# EasyEDA Pro project ProPrj_Codex_key_2026-10-20_10-08-15_2026-11-04.epro, board Keyboard_91_Centered_1
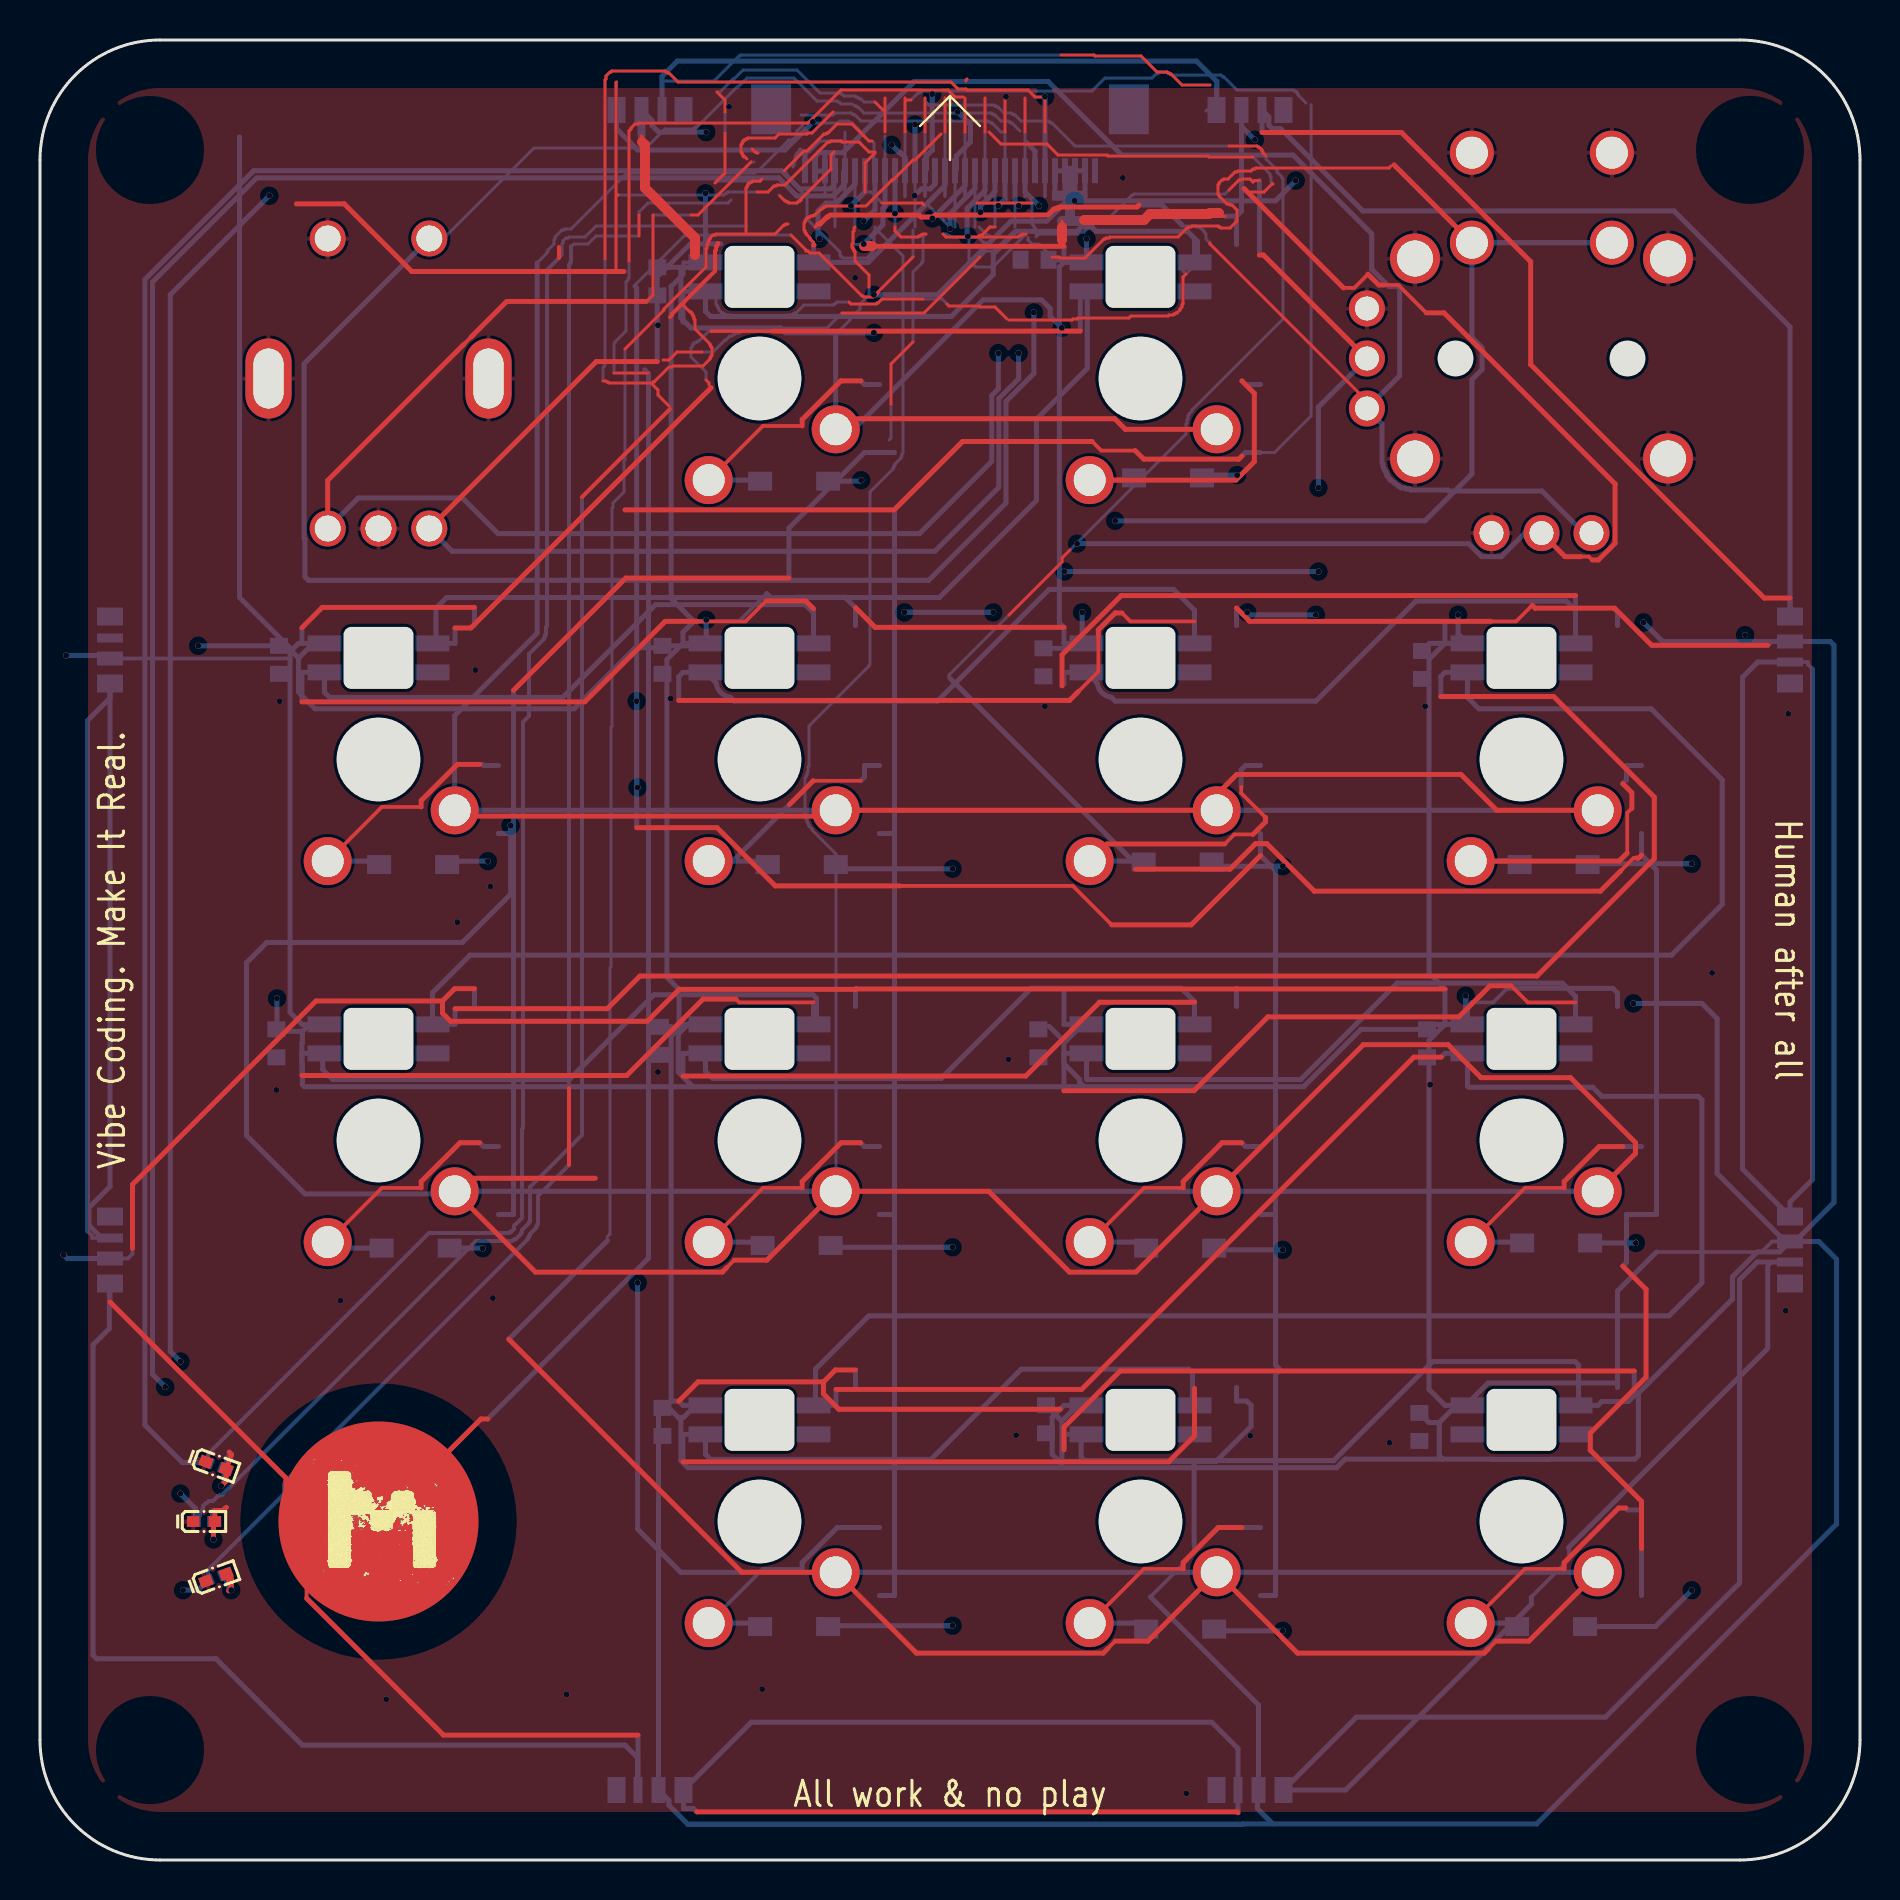
[diagram p6: board, top side]
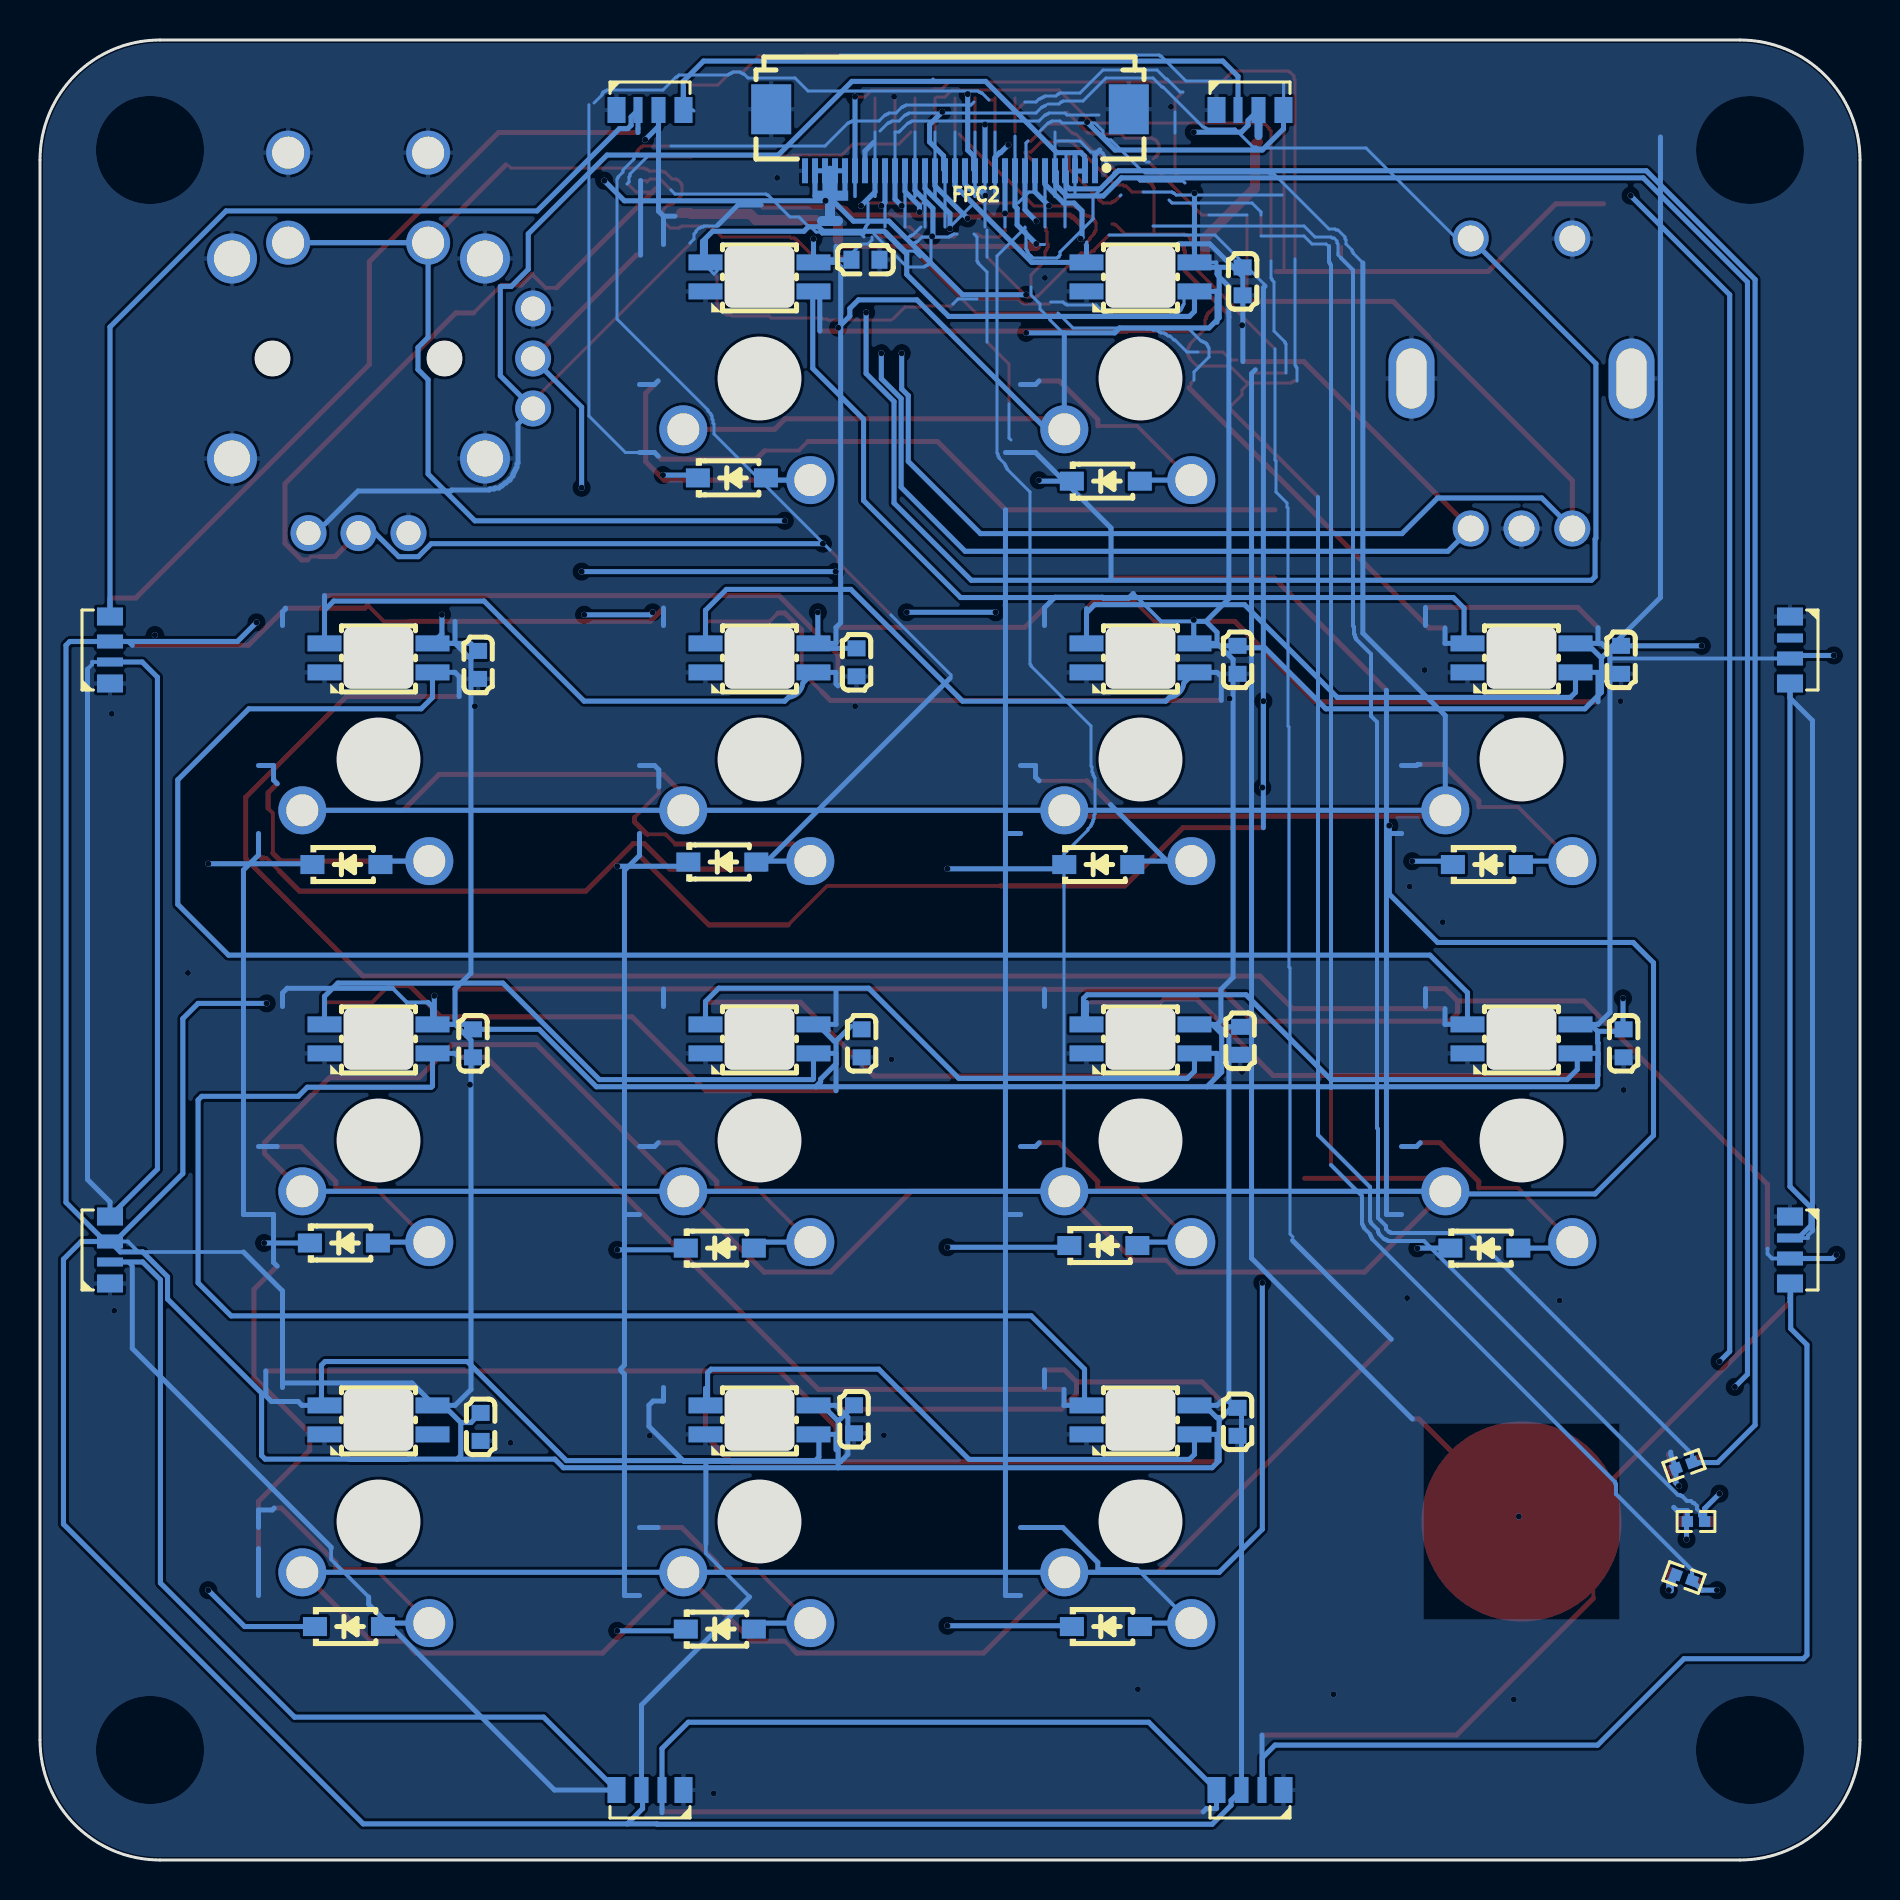
[diagram p7: board, bottom side, seen from below]

Outline 91 x 91 mm; copper layers: Top Layer, In1.Cu, In2.Cu, Bottom Layer. Coordinates in mm from the lower left corner of the outline.
Outline path: 0,85 arc(1.76,89.24) 6,91 85,91 arc(89.24,89.24) 91,85 91,6 arc(89.24,1.76) 85,0 6,0 arc(1.76,1.76) 0,6 0,85
Stack: Top Layer 0.035mm Outer layer thickness 1oz / Dielectric1 0.2104mm 7628 RC49% 8.6mil / In1.Cu 0.035mm / Dielectric2 1.065mm 1.1mm H/HOZ Copper / In2.Cu 0.035mm / Dielectric3 0.2104mm 7628 RC49% 8.6mil / Bottom Layer 0.035mm Outer layer thickness 1oz

## Design rules (mm)
spacing copperThickness1oz (default): track to track 0.102, other pairs 0.152 to 0.3
spacing safeClearance1: track to track 0.152, other pairs 0.152 to 0.3
track width copperThickness1oz (default): min 0.127, default 0.254, max 2.54
differential pair differentialPair (default): width min 0.127, default 2.54, max 2.54; gap min 0.127, default 0.152
pour e1721 uses copper0_default, default
net GND uses copper0_copperThickness1oz
pour e3085 uses copper0_safeClearance1, safeClearance1

## Placement (name value [footprint] x y rotation side)
C1  100nF  [C0603]  30.87 78.93 90 bottom
C2  100nF  [C0603]  49.73 80.01 0 bottom
C3  100nF  [C0603]  11.95 60.01 90 bottom
C4  100nF  [C0603]  31.12 60.01 90 bottom
C5  100nF  [C0603]  50.17 59.88 90 bottom
C6  100nF  [C0603]  69.1 59.75 90 bottom
C7  100nF  [C0603]  11.82 40.83 90 bottom
C8  100nF  [C0603]  31 40.96 90 bottom
C9  100nF  [C0603]  49.92 40.83 90 bottom
C10  100nF  [C0603]  69.35 40.83 90 bottom
C11  100nF  [C0603]  31.12 21.91 90 bottom
C12  100nF  [C0603]  50.3 22.04 90 bottom
C13  100nF  [C0603]  68.97 21.66 90 bottom
D1  1N4148W-7-F  [SOD-123_L2.7-W1.6-LS3.7-RD-1]  37.71 68.94 180 bottom
D2  1N4148W-7-F  [SOD-123_L2.7-W1.6-LS3.7-RD-1]  56.4 69.11 180 bottom
D3  1N4148W-7-F  [SOD-123_L2.7-W1.6-LS3.7-RD-1]  18.66 49.77 180 bottom
D4  1N4148W-7-F  [SOD-123_L2.7-W1.6-LS3.7-RD-1]  38.09 49.77 180 bottom
D5  1N4148W-7-F  [SOD-123_L2.7-W1.6-LS3.7-RD-1]  56.88 49.9 180 bottom
D6  1N4148W-7-F  [SOD-123_L2.7-W1.6-LS3.7-RD-1]  75.68 49.77 180 bottom
D7  1N4148W-7-F  [SOD-123_L2.7-W1.6-LS3.7-RD-1]  18.78 30.59 180 bottom
D8  1N4148W-7-F  [SOD-123_L2.7-W1.6-LS3.7-RD-1]  37.83 30.72 180 bottom
D9  1N4148W-7-F  [SOD-123_L2.7-W1.6-LS3.7-RD-1]  57.01 30.59 180 bottom
D10  1N4148W-7-F  [SOD-123_L2.7-W1.6-LS3.7-RD-1]  75.81 30.85 180 bottom
D11  1N4148W-7-F  [SOD-123_L2.7-W1.6-LS3.7-RD-1]  37.71 11.67 180 bottom
D12  1N4148W-7-F  [SOD-123_L2.7-W1.6-LS3.7-RD-1]  57.01 11.54 180 bottom
D13  1N4148W-7-F  [SOD-123_L2.7-W1.6-LS3.7-RD-1]  75.55 11.67 180 bottom
FPC2  FPC-05F-30PH20  [FPC-SMD_30P-P0.50_XUNPU_FPC-05F-30PH20]  45.5 86 0 bottom
LED1  SK6812MINI-E  [LED-SMD_4P-L3.2-W2.8-LS5.9_SK6812MINI-E]  35.97 79.16 180 bottom
LED2  SK6812MINI-E  [LED-SMD_4P-L3.2-W2.8-LS5.9_SK6812MINI-E]  55.03 79.16 180 bottom
LED3  SK6812MINI-E  [LED-SMD_4P-L3.2-W2.8-LS5.9_SK6812MINI-E]  16.92 60.11 180 bottom
LED4  SK6812MINI-E  [LED-SMD_4P-L3.2-W2.8-LS5.9_SK6812MINI-E]  35.97 60.11 180 bottom
LED5  SK6812MINI-E  [LED-SMD_4P-L3.2-W2.8-LS5.9_SK6812MINI-E]  55.03 60.11 180 bottom
LED6  SK6812MINI-E  [LED-SMD_4P-L3.2-W2.8-LS5.9_SK6812MINI-E]  74.07 60.11 180 bottom
LED7  SK6812MINI-E  [LED-SMD_4P-L3.2-W2.8-LS5.9_SK6812MINI-E]  16.92 41.06 180 bottom
LED8  SK6812MINI-E  [LED-SMD_4P-L3.2-W2.8-LS5.9_SK6812MINI-E]  35.97 41.06 180 bottom
LED9  SK6812MINI-E  [LED-SMD_4P-L3.2-W2.8-LS5.9_SK6812MINI-E]  55.03 41.06 180 bottom
LED10  SK6812MINI-E  [LED-SMD_4P-L3.2-W2.8-LS5.9_SK6812MINI-E]  74.07 41.06 180 bottom
LED11  SK6812MINI-E  [LED-SMD_4P-L3.2-W2.8-LS5.9_SK6812MINI-E]  35.97 22 180 bottom
LED12  SK6812MINI-E  [LED-SMD_4P-L3.2-W2.8-LS5.9_SK6812MINI-E]  55.03 22 180 bottom
LED13  SK6812MINI-E  [LED-SMD_4P-L3.2-W2.8-LS5.9_SK6812MINI-E]  74.07 22 180 bottom
NOREF  -  [Pad_e2175]  16.92 16.93 0 top
NOREF#2  -  [Pad_e2006]  51.47 83.22 0 top
R1  1kΩ  [R0402]  8.8 19.72 340 bottom
R2  1kΩ  [R0402]  8.8 14.12 20 bottom
R5  1kΩ  [R0402]  8.2 16.93 0 bottom
SW1  EC11E18244A5  [SW-TH_EC11E18244A5]  16.92 73.83 0 top
U1  CPG151101D13  [KEY-TH_CPG151101D21X]  36.61 70.27 180 top
U2  WS2812B-4020-V6  [LED-SMD_4P-L4.0-W1.7_DCS-CA4020A0R02G02B02CE004]  30.5 87.5 0 bottom
U3  WS2812B-4020-V6  [LED-SMD_4P-L4.0-W1.7_DCS-CA4020A0R02G02B02CE004]  60.5 87.5 0 bottom
U4  CPG151101D13  [KEY-TH_CPG151101D21X]  55.66 70.27 180 top
U5  CPG151101D13  [KEY-TH_CPG151101D21X]  17.56 51.22 180 top
U6  WS2812B-4020-V6  [LED-SMD_4P-L4.0-W1.7_DCS-CA4020A0R02G02B02CE004]  87.5 60.5 270 bottom
U7  CPG151101D13  [KEY-TH_CPG151101D21X]  36.61 51.22 180 top
U8  WS2812B-4020-V6  [LED-SMD_4P-L4.0-W1.7_DCS-CA4020A0R02G02B02CE004]  87.5 30.5 270 bottom
U9  WS2812B-4020-V6  [LED-SMD_4P-L4.0-W1.7_DCS-CA4020A0R02G02B02CE004]  60.5 3.5 180 bottom
U10  WS2812B-4020-V6  [LED-SMD_4P-L4.0-W1.7_DCS-CA4020A0R02G02B02CE004]  30.5 3.5 180 bottom
U11  WS2812B-4020-V6  [LED-SMD_4P-L4.0-W1.7_DCS-CA4020A0R02G02B02CE004]  3.5 30.5 90 bottom
U12  WS2812B-4020-V6  [LED-SMD_4P-L4.0-W1.7_DCS-CA4020A0R02G02B02CE004]  3.5 60.5 90 bottom
U13  XL-1005UWC  [LED0402-RD_YELLOW]  8.8 19.72 340 top
U14  CPG151101D13  [KEY-TH_CPG151101D21X]  55.66 51.22 180 top
U15  CPG151101D13  [KEY-TH_CPG151101D21X]  74.71 51.22 180 top
U16  CPG151101D13  [KEY-TH_CPG151101D21X]  17.56 32.17 180 top
U17  CPG151101D13  [KEY-TH_CPG151101D21X]  36.61 32.17 180 top
U18  CPG151101D13  [KEY-TH_CPG151101D21X]  55.66 32.17 180 top
U19  CPG151101D13  [KEY-TH_CPG151101D21X]  74.71 32.17 180 top
U20  CPG151101D13  [KEY-TH_CPG151101D21X]  36.61 13.12 180 top
U21  CPG151101D13  [KEY-TH_CPG151101D21X]  55.66 13.12 180 top
U22  CPG151101D13  [KEY-TH_CPG151101D21X]  74.71 13.12 180 top
U23  XL-1005UWC  [LED0402-RD_YELLOW]  8.2 16.93 0 top
U24  XL-1005UWC  [LED0402-RD_YELLOW]  8.8 14.12 20 top
VR1  10kΩ  [SW-TH_RKJXV1224005]  73.87 75.86 180 top

## Footprints (pads in the part's own frame, mm; a bottom-side part is the same pattern mirrored in y, then rotated)
C0603
  rect 0.8x0.9 smd: 1(-0.7,0) 2(0.7,0)
FPC-SMD_30P-P0.50_XUNPU_FPC-05F-30PH20
  rect 0.3x1.25 smd: 1(-7.25,1.538) 2(-6.75,1.538) 3(-6.25,1.538) 4(-5.75,1.538) 5(-5.25,1.538) 6(-4.75,1.538) 7(-4.25,1.538) 8(-3.75,1.538) 9(-3.25,1.538) 10(-2.75,1.538) 11(-2.25,1.538) 12(-1.75,1.538) 13(-1.25,1.538) 14(-0.75,1.538) 15(-0.25,1.538) 16(0.25,1.538) 17(0.75,1.538) 18(1.25,1.538) 19(1.75,1.538) 20(2.25,1.538) 21(2.75,1.538) 22(3.25,1.538) 23(3.75,1.538) 24(4.25,1.538) 25(4.75,1.538) 26(5.25,1.538) 27(5.75,1.538) 28(6.25,1.538) 29(6.75,1.538) 30(7.25,1.538)
  rect 2x2.5 smd: 31(8.94,-1.538) 32(-8.94,-1.538)
KEY-TH_CPG151101D21X
  round 2.4 hole 1.6: 1(-3.175,-1.27) 2(3.175,1.27)
LED0402-RD_YELLOW
  rect 0.636x0.54 smd: 1(-0.538,0) 2(0.538,0)
LED-SMD_4P-L3.2-W2.8-LS5.9_SK6812MINI-E
  rect 1.7x0.8 smd: 1(-2.7,-0.725) 2(-2.7,0.725) 3(2.7,0.725) 4(2.7,-0.725)
LED-SMD_4P-L4.0-W1.7_DCS-CA4020A0R02G02B02CE004
  rect 0.9x1.3 smd: 1(-1.675,0) 4(1.675,0)
  rect 0.7x1.3 smd: 2(-0.425,0)
  rect 0.45x1.3 smd: 3(0.6,0)
Pad_e2006
  custom 1.761x0.516 smd far side: 33(0,0)
Pad_e2175
  round 10 smd: 1(0,0)
R0402
  rect 0.566x0.54 smd: 1(-0.433,0) 2(0.433,0)
SOD-123_L2.7-W1.6-LS3.7-RD-1
  rect 1.2x0.95 smd: 1(-1.7,0) 2(1.7,0)
SW-TH_EC11E18244A5
  oval 2.3x4 hole 1.5x3: 6(5.5,0.25) 7(-5.5,0.25)
  round 1.8 hole 1.3: A(-2.54,-7.25) B(2.54,-7.25) C(0,-7.25) D(-2.54,7.25) E(2.54,7.25)
SW-TH_RKJXV1224005
  round 1.8 hole 1.2: 1(7.527,-1.719) 2(7.527,0.781) 3(7.527,3.281) 4(1.298,9.511) 5(-1.202,9.511) 6(-3.703,9.511)
  round 2.5 hole 1.8: 7(-7.527,5.781) 8(-7.527,-4.219) 9(5.122,-4.219) 10(5.122,5.781)
  round 2.2 hole 1.6: a(-4.721,-5.011) b(-4.721,-9.511) c(2.279,-5.011) d(2.279,-9.511)

## Nets
As in the schematic, except:
+5V: C1.2 C2.2 C3.2 C4.2 C5.2 C6.2 C7.2 C8.2 C9.2 C10.2 C11.2 C12.2 C13.2 FPC2.26 FPC2.27 FPC2.28 FPC2.29 LED1.3 LED2.3 LED3.3 LED4.3 LED5.3 LED6.3 LED7.3 LED8.3 LED9.3 LED10.3 LED11.3 LED12.3 LED13.3 NOREF#2.33 U2.2 U3.2 U6.2 U8.2 U9.2 U10.2 U11.2 U12.2
Touch: FPC2.17 NOREF.1

Pads without a net: LED13 4; U12 3

## Via types
v1: diameter 0.305, hole 0.61, Top Layer to Bottom Layer, 105 vias

## Routing (per net, layer and track width the routed paths; a pad name or vN(x,y) marks a point on that pad's centre or on a via; arc(x,y) is an arc through that point)
+5V: length 520.3
  In2.Cu w0.254: v1(52.32,81.06) 51.73,81.65 v1(51.73,82.96) ; v1(33.31,62.01) 33.59,62.29 43.12,62.29 v1(43.22,62.39) ; v1(79.67,42.83) 78.02,42.83 77.63,43.21 v1(71.28,43.21) ; v1(41.69,78.26) v1(41.69,76.36) ; v1(60.36,62.39) v1(52.11,62.39) v1(47.66,62.39) ; v1(33.28,83.34) 33.31,83.38 v1(33.31,86.39) ; v1(85.25,61.24) 85.25,62.47 71.32,76.4 70.35,76.4 68.02,78.73 arc(67.67,78.99) 67.4,79.35 v1(62.79,83.97) v1(60.74,86.01) ; v1(80.18,61.88) 79.79,62.26 v1(70.9,62.26) v1(63.79,62.26) ; v1(1.31,60.23) 1.79,60.71 v1(7.91,60.71) ; v1(1.18,30.26) 1.18,32.42 v1(11.85,43.08)
  Bottom Layer w0.254: 51.09,19.61 32.4,19.61 32.04,19.97 32.04,22 31.91,22.13 ; 51.09,19.61 64.83,19.61 65.26,20.04 70.14,20.04 ; 51.09,19.61 51.09,21.94 ; 52.21,38.66 51.97,38.91 51.97,39.04 51.2,39.81 51.2,40.95 ; 52.21,38.66 32.65,38.66 ; 52.21,38.66 63.18,38.66 66.05,41.53 C10.2 69.6,41.78 LED10.3 71.28,41.87 v1(71.28,43.21) ; v1(52.11,62.39) 52.11,61.05 52.32,60.83 52.08,60.58 C5.2 ; 52.2,80.01 52.19,80.01 C2.2 ; 52.2,80.01 52.32,79.88 ; 52.2,80.01 52.32,80.13 v1(52.32,81.06) ; 51.9,83.07 52.1,83.07 52.25,83.22 FPC2.29 ; 32.65,38.66 13.22,38.66 13.12,38.77 13.12,39.79 13.1,39.81 13.1,40.85 13.12,40.87 13.12,41.43 ; 32.65,38.66 31.91,39.4 31.91,41.31 ; v1(33.31,62.01) 33.31,60.87 LED4.3 33.15,60.71 C4.2 31.02,60.61 29.76,60.61 26.71,57.56 13.75,57.56 12.93,58.39 12.93,60.1 ; v1(60.36,62.39) 60.49,62.26 v1(63.79,62.26) ; 31.91,41.31 31.56,41.66 C8.2 ; 31.91,41.31 32.39,41.78 LED8.3 ; U10.2 31.45,2.98 31.45,2.73 32.39,1.79 60.14,1.79 60.16,1.81 61.63,1.81 ; 70.14,20.04 72.57,20.04 arc(72.65,20.03) 72.72,20.03 75.43,20.03 arc(75.5,20.03) 75.58,20.04 79.74,20.04 79.92,20.22 79.92,23.35 84.62,28.05 84.62,29.16 85.87,30.4 86.98,30.4 U8.2 87.25,30.92 83.86,34.32 83.86,42.07 83.1,42.83 v1(79.67,42.83) ; 70.14,20.04 69.96,20.22 69.96,21.87 ; C6.2 69.47,60.83 LED6.3 70.9,61.3 v1(70.9,62.26) ; 31.91,22.13 32.17,22.13 32.77,22.73 LED11.3 ; 31.91,22.13 31.43,22.61 31.12,22.61 ; 12.93,60.1 13.66,60.83 LED3.3 ; 12.93,60.1 12.32,60.71 C3.2 v1(7.91,60.71) ; 13.12,41.43 11.92,41.43 C7.2 11.85,41.56 v1(11.85,43.08) ; 13.12,41.43 13.47,41.78 LED7.3 ; v1(41.69,78.26) 44.87,78.26 48.55,81.94 50.33,81.94 51.47,83.09 ; U11.2 1.36,30.08 v1(1.18,30.26) ; FPC2.28 51.75,83.22 ; 51.2,40.95 51.3,40.95 52.13,41.78 52.32,41.78 ; 51.2,40.95 50.46,41.69 ; v1(41.69,76.36) 37.27,76.36 37.02,76.6 32.55,76.6 32.04,77.11 32.04,79.61 32.06,79.63 ; U3.2 60.07,86.68 v1(60.74,86.01) ; 51.09,21.94 51.88,22.73 52.32,22.73 ; 51.09,21.94 C12.2 ; U12.2 3.35,60.23 v1(1.31,60.23) ; 50.9,83.2 50.75,83.34 FPC2.26 ; C1.2 32.06,79.63 ; 32.06,79.63 33.03,79.63 LED1.3 v1(33.28,83.34) ; v1(47.66,62.39) v1(43.22,62.39) ; 69.96,21.87 69.45,21.87 C13.2 ; 69.96,21.87 70.82,22.73 LED13.3 ; 61.63,1.81 60.87,2.57 60.87,3.45 U9.2 ; 61.63,1.81 74.84,1.81 89.83,16.79 89.83,30.04 88.94,30.92 87.75,30.92 89.7,32.88 89.7,60.74 89.51,60.92 U6.2 81.13,60.92 v1(80.18,61.88) ; U2.2 30.6,86.98 30.6,86.73 30.94,86.39 v1(33.31,86.39) ; v1(62.79,83.97) 61.78,82.96 51.9,82.96 ; NOREF#2.33 51.38,83.22 ; 51.25,83.34 FPC2.27
GND: length 4.7
  Bottom Layer w0.254: v1(43.73,83.22) 44.07,83.56 44.52,83.56 44.75,83.79 FPC2.14 ; FPC2.1 38.25,85.26 38.01,85.5 ; FPC2.24 49.75,85.45 49.32,85.88
  vias: v1(11.82,38.5) v1(11.98,57.94) v1(15.02,27.97) v1(17.31,8.03) v1(20.87,46.89) v1(21.77,59.5) v1(22.52,48.67) v1(22.64,28.1) v1(26.33,8.28) v1(30.9,76.74) v1(30.9,39.4) v1(31.53,58.07) v1(34.46,87.66) v1(36.11,8.54) v1(40.75,79.11) v1(48.3,88.17) v1(48.43,40.03) v1(48.81,21.24) v1(50.25,57.69) v1(54.14,84.1) v1(57.31,3.33) v1(60.52,21.21) v1(67.47,20.86) v1(69.25,57.69) v1(69.51,38.77) v1(83.6,44.35) v1(87.29,27.46) v1(87.41,57.31)
VCC: length 58.3
  In2.Cu w0.254: VR1.6 71.34,72.58 66.35,72.58
  Bottom Layer w0.254: FPC2.2 38.77,84.49 38.77,85.19 38.95,85.37 39.24,85.37 ; 39.24,85.37 39.25,85.36 FPC2.3 ; 39.24,85.37 40.15,85.37 43.72,88.93 50.4,88.93 54.09,85.25 62.65,85.25 66.59,81.31 66.59,79.53 67.44,78.68 67.98,78.68 67.98,74.21 66.35,72.58
(no net): length 3065.4
  Top Layer w0.15: 48.45,62.25 51.1,64.9 51.1,65.1 51.5,65.5 ; 41.75,85.35 41.25,84.85 41.25,83.4 ; 32.55,82.25 32.9,82.25 35.55,84.9 ; 29.25,75.55 31.2,77.5 31.2,77.55 33.3,79.65 33.3,80.55 33.35,80.6 33.35,80.75 33.4,80.8 33.4,80.9 33.45,80.95 33.45,81 33.5,81.05 33.5,81.1 33.65,81.25 33.75,81.25 33.8,81.3 36.75,81.3 37.2,81.75 37.25,81.75 37.3,81.8 37.4,81.8 ; 44.2,82.75 44.1,82.85 42.1,82.85 ; 30.6,73.8 30.9,73.5 30.9,73.25 31.45,72.7 ; 44.25,86.4 44.25,88.1 ; 50.25,86.4 50.25,88.1 ; 46.3,88.95 46.3,89 46.35,89.05 ; 38.75,81.65 38.9,81.8 ; 28.25,80.05 28.25,89 28.3,89.05 28.3,89.2 28.5,89.4 28.55,89.4 28.6,89.45 31.25,89.45 31.3,89.4 31.35,89.4 31.4,89.35 31.45,89.35 31.9,88.9 45.55,88.9 45.9,88.55 46.3,88.55 46.35,88.5 49.4,88.5 49.75,88.15 50.15,88.15 ; 29.45,79.95 29.45,86.45 29.55,86.55 29.55,86.6 29.75,86.8 29.9,86.8 29.95,86.85 38.4,86.85 40.05,88.5 45.4,88.5 45.75,88.15 46.15,88.15 ; 47,81.15 48.9,81.15 48.95,81.2 49,81.2 49.05,81.25 49.1,81.25 49.15,81.3 49.3,81.3 ; 33.45,73.75 33.45,73.85 33.3,74 ; 47.45,86.4 48.05,85.8 50.35,85.8 50.9,85.25 53.35,85.25 53.4,85.2 58.4,85.2 58.45,85.15 60.65,85.15 ; 44.15,78.05 42.1,78.05 41.9,77.85 41.85,77.85 41.8,77.8 40.55,77.8 40.45,77.9 ; 34.25,87.4 34.25,88 33.85,88.4 ; 49.25,86.4 49.25,88.1 ; 48.45,77 51.6,77 51.65,77.05 51.85,77.05 51.9,77.1 54.45,77.1 54.55,77.2 56.4,77.2 56.45,77.25 56.65,77.25 56.7,77.3 56.75,77.3 56.8,77.35 56.85,77.35 57,77.5 57,77.55 57.1,77.65 57.1,77.75 57.15,77.8 57.15,79.15 57.3,79.3 ; 31.45,74.65 31.6,74.65 31.65,74.7 33.15,74.7 33.5,75.05 33.5,75.1 33.55,75.15 33.55,75.2 33.6,75.25 33.6,75.6 33.55,75.65 33.55,75.7 33.5,75.75 33.5,75.8 32.75,76.55 32.75,77 32.7,77.05 32.7,77.15 32.65,77.2 32.65,77.25 32.6,77.3 32.6,77.35 32.55,77.4 32.5,77.4 32.15,77.75 ; 42.75,81.65 42.75,81.45 43.05,81.15 43.9,81.15 43.95,81.2 44,81.2 44.05,81.25 44.1,81.25 44.15,81.3 44.3,81.3 ; 58.95,82.35 59.11,82.19 59.25,82.19 ; 42.55,72.8 42.55,74.8 43.65,75.9 ; 59.45,83.5 59.95,84 60.05,84 60.1,84.05 60.5,84.05 60.65,83.9 60.72,83.97 60.97,83.97 ; 35.35,85.05 35.25,85.15 35.2,85.15 35.15,85.2 35.15,85.25 35.1,85.3 35.1,85.35 35.05,85.4 35.05,85.75 35.1,85.8 35.1,85.85 35.15,85.9 35.15,85.95 35.2,86 35.25,86 35.3,86.05 35.35,86.05 35.4,86.1 36.75,86.1 36.95,86.3 38.35,86.3 38.4,86.35 38.6,86.35 39.65,87.4 ; 28.8,79.6 28.8,88.88 28.82,88.9 ; 33.75,83.85 34.25,84.35 34.25,86.35 ; 40.75,81.65 40.7,81.6 40.7,81.45 40.65,81.4 40.65,80.85 40.6,80.8 40.6,80.65 40.65,80.6 40.65,80.55 40.7,80.5 40.7,80.45 40.75,80.4 40.75,79.95 41.45,79.25 41.45,78.65 ; 31.15,75 31.45,75 31.85,75.4 33.1,75.4 ; 41.6,85.95 41.45,85.95 40.6,86.8 39.85,86.8 39.4,86.35 39.35,86.35 39.3,86.3 39.2,86.3 38.35,85.45 38.2,85.45 37.2,84.45 ; 41.75,87.9 42.15,87.5 ; 58.5,88.75 57.1,88.75 56.55,89.3 56.5,89.3 56.45,89.35 56.4,89.35 56.35,89.4 55.85,89.4 55.05,90.2 52.75,90.2 52.7,90.25 51.05,90.25 ; 39.7,85.4 39.55,85.25 39.55,84.55 38.05,83.05 38.05,83 38,83 38,82.95 37.95,82.95 37.85,82.85 37.45,82.85 37.4,82.9 37.35,82.9 37.3,82.95 37.25,82.95 37,83.2 ; 48.35,77.05 47.75,77.65 47,77.65 46.95,77.7 45.45,77.7 45.35,77.8 ; 58.5,80.85 58.5,80.8 65.9,73.4 65.9,73.02 66.34,72.58 ; 30.07,86.2 30.1,86.17 30.1,85.9 ; 35.3,81.4 35.3,83.6 35.35,83.65 35.35,83.7 35.4,83.75 35.4,83.8 35.45,83.85 35.5,83.85 35.55,83.9 35.6,83.9 35.65,83.95 36,83.95 36.1,84.05 ; 46.25,86.4 46.25,88.1 ; 31.4,74.6 30.7,73.9 30.65,73.9 30.6,73.85 28.45,73.85 28.4,73.9 28.35,73.9 28.3,73.95 28.15,73.95 ; 47.25,86.4 47.25,88.1 ; 30.32,77.93 30.33,77.93 30.65,78.25 30.65,82.25 ; 51.1,81.65 51.1,81.95 ; 47,80.15 44.2,77.35 40.1,77.35 ; 28.85,83.25 28.9,83.25 ; 46.85,82.85 49.6,82.85 ; 41.3,82.7 39.3,82.7 39.25,82.65 39.2,82.65 39.1,82.55 39.05,82.55 38.75,82.25 38.7,82.25 38.65,82.2 38.55,82.2 38.5,82.15 38.45,82.15 38.4,82.1 38.35,82.1 38.3,82.05 38.3,82 38.25,81.95 38.25,81.9 38.2,81.85 38.2,81.5 38.25,81.45 38.25,81.4 38.3,81.35 38.3,81.3 38.5,81.1 38.5,81.05 38.68,80.88 38.68,80.75 ; 45.05,86.3 43.75,85 43.65,85 42.65,84 42.6,84 41.35,82.75 ; 37.55,81.25 38.3,80.5 38.3,80.45 38.4,80.45 38.5,80.35 38.95,80.35 41.1,78.2 41.15,78.2 41.2,78.15 41.65,78.15 41.7,78.2 41.75,78.2 41.9,78.35 41.9,78.4 43.65,80.15 ; 60.55,83.4 61.2,83.4 61.6,83.8 61.65,83.8 ; 41.6,80.7 41.62,80.69 41.72,80.69 ; 29.95,82.25 29.95,81.2 ; 67.55,84.7 67.45,84.6 60.8,84.6 60.75,84.55 60.65,84.55 60.55,84.45 59.9,84.45 59.85,84.4 59.75,84.4 59.4,84.05 59.2,84.05 59.15,84 59.1,84 58.95,83.85 58.95,83.8 58.9,83.75 58.9,83.3 58.95,83.25 58.95,83.2 59.35,82.8 59.45,82.8 59.5,82.75 59.6,82.75 59.85,82.5 59.85,81.95 59.5,81.6 59.05,81.6 59,81.65 58.95,81.65 58.9,81.7 57.6,81.7 57.55,81.65 57.45,81.65 57.4,81.6 57.35,81.6 56.9,81.15 53.5,81.15 53.45,81.1 53.3,81.1 53.25,81.05 53.2,81.05 52.25,80.1 51,80.1 50.95,80.15 50.6,80.15 ; 43.3,88 43.55,88 ; 47.75,81.65 47.5,81.65 47.1,81.25 47.05,81.25 47,81.2 46.95,81.2 46.9,81.15 45.3,81.15 45.15,81.3 ; 35.6,85.55 35.75,85.4 35.8,85.4 35.85,85.35 35.9,85.35 ; 42.25,86.4 42.25,88.1 ; 41.75,85.4 41.45,85.4 40.95,85.9 40.1,85.9 40.05,85.95 39.55,85.95 39.5,85.9 39.4,85.9 37.25,83.75 36.85,83.75 36.8,83.7 36.7,83.7 36.4,83.4 35.85,83.4 ; 28.7,74.35 30.4,74.35 ; 43.25,86.4 43.25,88.1 ; 59.45,85.7 60.85,85.7 60.9,85.65 60.95,85.65 61.1,85.5 61.1,85.45 61.15,85.4 61.15,85.35 61.3,85.2 ; 45.25,86.4 45.25,88.1 ; 48.25,86.4 48.25,88.1
  Top Layer w0.188: 72.81,10.94 72.44,10.57 ; 19.06,52.65 17.09,52.65 14.39,49.94 ; 53.59,46.76 51.64,48.7 42.99,48.7 ; 76.21,14.55 74.24,14.55 71.53,11.84 ; 79.36,50.35 79.36,52.35 79.59,52.58 ; 52.49,30.89 55.19,33.6 57.16,33.6 ; 65.17,78.61 65.72,78.61 66.4,79.29 ; 76.78,42.88 74.39,42.88 73.56,43.71 ; 52.61,70.92 53.06,70.47 54.76,70.47 ; 57.72,61.93 54.52,61.93 54.1,62.35 ; 51.92,58.42 52.92,59.42 52.92,61.22 ; 76.21,33.6 74.24,33.6 71.53,30.89 ; 77.61,65 77.44,65.17 77.04,65.17 ; 57.16,14.55 55.19,14.55 52.49,11.84 ; 12.3,15.51 13.33,14.47 13.33,13.09 ; 32.86,61.93 35.28,61.93 36.3,62.95 ; 34.79,43.05 34.96,42.88 38.68,42.88 ; 14.39,30.89 17.09,33.6 19.06,33.6 ; 33.44,69 36.14,71.7 38.11,71.7 ; 61.27,52.13 60.06,53.35 60.06,53.65 ; 72.55,61.93 73.8,61.93 74.61,62.74 ; 21.2,75.79 21.56,76.15 ; 38.11,33.6 36.14,33.6 33.44,30.89 ; 53.76,10.94 53.39,10.57 ; 59.24,50.8 59.72,51.28 60.65,51.28 ; 79.79,50.1 79.68,50.1 79.04,49.46 ; 69.31,77.36 67.92,78.75 67.22,78.75 ; 34.71,29.99 34.34,29.62 ; 33.56,76.45 36.63,76.45 ; 38.66,53.96 41.04,53.96
  Top Layer w0.2: 26.45,34.75 26.45,38.6 ; 31.5,72.55 27.1,68.15 ; 33.9,80.85 33.9,80.8 33.85,80.75 33.85,80.7 33.8,80.65 33.8,80.5 33.75,80.45 33.75,79.45 31.6,77.3 31.6,77.25 31.5,77.15 ; 25.95,80.1 25.95,80.65
  Top Layer w0.25: 23.68,58.49 29.29,64.1 37.45,64.1 ; 14.39,66.58 14.39,68.98 21.2,75.79 ; 61.27,52.13 61.27,51.91 60.65,51.28 ; 38.11,33.6 38.11,33.92 40.05,35.86 41.04,35.86 ; 38.66,53.96 38.66,53.95 37.47,52.77 ; 70.06,40.14 68.69,40.14 52.08,23.53 39.8,23.53 ; 70.04,58.17 75.68,58.17 80.71,53.14 80.71,50.06 74.85,44.2 29.99,44.2 28.36,42.56 20.75,42.56 ; 57.72,42.89 52.98,42.89 49.29,39.2 32.15,39.2 ; 33.56,73.62 21.54,61.6 20.75,61.6 ; 40.78,62.61 41.76,61.63 51.2,61.63 ; 9.31,17.63 9.15,17.47 8.74,17.47 8.74,16.93 ; 34.34,29.62 34.11,29.39 24.78,29.39 20.73,33.44 21.39,34.09 27.76,34.09 ; 60.09,16.62 58.91,16.62 57.16,14.87 57.16,14.55 ; 19.47,66.58 27.81,74.92 30.86,74.92 ; 13.33,13.09 20.17,6.25 29.9,6.25 ; 12.83,82.81 15.21,82.81 18.59,79.43 29.2,79.43 ; 77.04,65.17 76.25,65.17 75.07,66.34 ; 77.61,65 77.92,65 78.75,65.83 78.75,68.81 70.2,77.36 69.31,77.36 ; 79.14,53.82 79.59,53.36 79.59,52.58 ; 79.15,35.67 77.96,35.67 76.21,33.92 76.21,33.6 ; 59.24,50.8 53.34,50.8 52.49,49.94 ; 51.2,20.51 51.2,21.64 54.01,24.45 79.71,24.45 ; 72.81,10.94 74.44,10.94 77.88,14.38 ; 79.14,29.69 80.3,28.53 80.3,24.14 77.51,21.35 77.51,20.49 80.07,17.93 80.07,15.57 ; 77.88,33.44 79.77,35.32 79.77,35.87 76.52,39.12 72.05,39.12 70.4,40.77 66.17,40.77 58.84,33.44 54.8,29.4 51.48,29.4 47.44,33.44 39.78,33.44 36.34,29.99 34.71,29.99 ; 30.32,77.93 23.34,77.93 21.56,76.15 ; 79.36,50.35 78.96,49.94 71.53,49.94 ; 79.04,49.46 78.02,48.44 63.72,48.44 61.34,50.82 60.78,50.82 59.51,49.55 54.78,49.55 ; 38.68,80.75 38.7,80.75 ; 74.61,62.74 74.76,62.59 78.73,62.59 80.58,60.74 86.39,60.74 ; 66.4,79.29 66.94,78.75 67.22,78.75 ; 58.84,71.53 54.26,71.53 53.74,72.06 40.31,72.06 39.78,71.53 ; 9.46,20.39 9.57,20.29 9.57,20.26 9.31,19.54 ; 60.09,70.19 59.94,70.04 55.19,70.04 54.76,70.47 ; 87.5,63.1 86.21,63.1 74.53,74.78 74.53,79.92 68.07,86.38 61.1,86.38 ; 51.92,58.42 51.47,57.98 31.94,57.98 ; 21.72,62.63 14.11,62.63 13.1,61.61 ; 13.1,39.22 29.34,39.22 33.16,43.05 34.79,43.05 ; 22.38,22.05 22.05,22.05 16.92,16.93 ; 54.95,82.75 54.85,82.65 51,82.65 50.95,82.6 50.85,82.6 50.8,82.55 50.7,82.55 50.4,82.25 ; 41.04,73.95 40.04,73.95 38.11,72.02 38.11,71.7 ; 39.5,82.25 39.4,82.15 39.35,82.15 39,81.8 38.9,81.8 ; 79.29,17.6 78.93,17.6 76.21,14.87 76.21,14.55 ; 72.44,10.57 72.21,10.34 62.88,10.34 58.84,14.38 55.39,10.94 53.76,10.94 ; 53.59,46.76 57.56,46.76 61.03,50.22 ; 73.56,43.71 72.5,43.71 70.95,42.16 61.4,42.16 57.7,38.46 51.2,38.46 ; 12.3,15.51 12.3,19.1 3.5,27.9 ; 57.72,23.58 57.72,21.2 56.43,19.91 32.15,19.91 ; 21.72,43.56 20.74,43.56 20.12,42.95 ; 31.95,43.53 30.36,41.94 20.53,41.94 20.12,42.34 20.12,42.95 ; 60.09,73.95 60.72,73.33 60.72,69.92 59.79,69 52.49,69 ; 77.88,52.48 72.84,52.48 71.05,54.28 59.84,54.28 58.84,53.27 58.84,52.48 39.78,52.48 39.49,52.19 21.03,52.19 20.73,52.48 ; 60.09,35.86 59.1,35.86 57.16,33.92 57.16,33.6 ; 42.99,48.7 36.76,48.7 33.85,51.62 29.83,51.62 ; 23.44,26.04 35.09,14.38 39.78,14.38 43.83,10.34 53.16,10.34 53.39,10.57 ; 38.68,62.56 38.28,62.95 36.3,62.95 ; 80.07,50.25 79.92,50.1 79.79,50.1 ; 20.12,42.95 13.8,42.95 12.86,42.02 4.62,33.78 4.62,30.58 ; 70.25,43.55 40.8,43.55 40.78,43.53 31.96,43.53 ; 52.92,61.22 52.92,61.51 53.76,62.35 54.1,62.35 ; 65.17,78.61 60.21,83.57 ; 22,54.78 20.86,54.78 19.06,52.97 19.06,52.65 ; 36.63,76.45 52.01,76.45 ; 60.97,80.25 61.17,80.25 66.34,75.08 ; 51.01,22.54 39.94,22.54 39.17,23.31 39.17,23.9 ; 72.55,61.93 60.49,61.93 59.82,62.6 ; 71.59,80.87 67.71,84.76 ; 32.84,2.41 59.86,2.41 59.9,2.37 ; 9.44,13.46 9.57,13.59 9.31,14.31 ; 39.17,23.9 39.77,24.5 40.78,24.5 ; 39.17,23.9 32.9,23.9 31.94,22.94 ; 51.1,58.71 51.1,60.26 54.06,63.22 76.78,63.22 ; 50.25,82.25 44.75,82.25 44.65,82.15 44.05,82.15 43.95,82.25 39.6,82.25 ; 21.99,35.86 21,35.86 19.06,33.92 19.06,33.6 ; 51.2,80.69 41.72,80.69 ; 13.1,57.91 27.24,57.91 31.26,61.93 32.86,61.93 ; 29.25,67.51 42.71,67.51 46.13,70.92 52.61,70.92
  Top Layer w0.5: 41.6,80.7 41.2,80.7 ; 51.1,81 51.1,81.65 ; 52.2,82 55.2,82 55.5,82.3 58.45,82.3 58.5,82.35 58.95,82.35 ; 30.1,85.9 30.25,85.75 30.25,83.6 32.75,81.1 32.75,80.25
  Bottom Layer w0.15: 63.55,87.76 63.55,72.2 61.73,70.38 61.03,70.38 ; 41.6,85.95 41.7,85.85 41.7,85.1 ; 34.55,83 34.4,82.85 30.4,82.85 29.95,82.4 29.95,82.25 ; 44.25,86.4 44.25,83.17 44.25,84.46 ; 37.65,84.65 37.65,84.7 37.7,84.75 37.7,84.9 37.75,84.95 37.75,85.15 37.8,85.2 37.8,85.25 37.85,85.3 37.85,85.35 37.9,85.35 37.95,85.4 38.45,85.4 39,85.95 40.15,85.95 ; 39.25,84.46 39.25,83.17 38.75,83.17 ; 39.75,83.17 39.75,81.65 ; 39.75,83.17 39.7,83.22 39.7,83.9 39.65,83.95 39.65,84 ; 39.75,83.17 39.75,84.46 ; 38.68,80.75 38.68,80.88 38.65,80.9 ; 49.25,86.4 49.25,83.17 49.25,84.46 ; 35.35,81.7 27.8,81.7 27.25,81.15 26.45,81.15 26.4,81.1 26.3,81.1 26.15,80.95 26.15,80.85 26.1,80.8 26.1,80.25 25.95,80.1 ; 46.25,86.4 46.25,83.17 46.25,84.46 ; 43.75,81.65 43.75,84.46 ; 58.5,80.85 58.3,81.05 58.3,81.3 58.2,81.4 58.2,81.45 58.05,81.6 58,81.6 57.95,81.65 57.85,81.65 57.8,81.7 57.15,81.7 57.1,81.75 ; 41.75,87.9 41.2,87.9 41.05,88.05 41,88.05 40.95,88.1 40.9,88.1 40.85,88.15 40.8,88.15 40.75,88.2 40.2,88.2 40.1,88.3 40.05,88.3 40,88.35 39,88.35 37.85,89.5 35.15,89.5 34.7,89.05 34.65,89.05 34,88.4 33.85,88.4 ; 38.05,87.25 39.65,87.25 39.75,87.35 40.55,87.35 40.6,87.3 40.65,87.3 40.7,87.25 40.75,87.25 41.05,86.95 47.4,86.95 47.45,86.9 47.5,86.9 47.55,86.85 47.6,86.85 48.05,86.4 48.25,86.4 48.25,83.17 48.25,84.46 ; 47.75,84.46 47.75,81.65 ; 49.6,82.85 49.6,81.8 49.7,81.7 49.7,81.65 49.75,81.6 49.75,81.55 49.8,81.5 49.8,81.3 ; 33.5,76.5 32.95,75.95 32.9,75.95 32.85,75.9 32.8,75.9 32.75,75.85 32.7,75.85 32.65,75.8 32.65,75.75 32.6,75.7 32.6,75.65 32.55,75.6 32.55,75.15 33.3,74.4 33.3,74 ; 49.95,80.8 50.6,80.15 ; 36.95,83.25 37,83.2 ; 29.45,79.95 29.45,79.1 29.4,79.05 29.4,79 29.3,78.9 29.3,76.45 28.75,75.9 28.75,75.85 28.7,75.8 28.7,74.35 ; 39.78,33.44 39.8,33.45 39.8,50.3 38.6,51.5 38.6,51.55 38.45,51.7 38.45,51.75 38.4,51.8 38.4,51.85 38.35,51.9 38.35,52 38.3,52.05 38.3,52.25 38.25,52.3 38.25,54.1 38.3,54.15 38.3,54.2 38.35,54.25 38.35,54.35 38.4,54.4 38.4,54.65 38.45,54.7 38.45,56.7 41.45,59.7 41.45,59.75 41.5,59.8 41.5,68.4 42.65,69.55 42.65,69.6 42.7,69.65 42.7,69.7 42.75,69.75 42.75,69.8 43.05,70.1 43.05,70.15 43.1,70.2 43.1,70.3 43.15,70.35 43.15,80.2 41.75,81.6 41.75,81.65 ; 44.45,82.7 45.5,81.65 ; 28.15,73.95 28.15,74.6 28.2,74.65 28.2,74.7 28.25,74.75 28.25,80.05 ; 37.2,84.45 37.3,84.35 37.3,84.2 38.35,83.15 38.35,82.05 40,80.4 40,80.25 40.05,80.2 40.05,80.15 40.1,80.15 40.15,80.1 41.35,80.1 41.4,80.15 41.45,80.15 41.45,80.2 41.6,80.35 41.6,80.4 41.65,80.45 41.65,80.5 41.7,80.55 41.7,81.45 ; 29.25,75.55 29.25,70 29.2,69.95 29.2,68.4 28.65,67.85 28.65,67.65 28.6,67.6 28.6,56.7 28.55,56.65 28.55,44.65 28.5,44.6 28.5,31.3 28.35,31.15 ; 48.7,81.45 47.7,80.45 47.3,80.45 47,80.15 ; 66.34,72.58 66.34,72.56 66.95,71.95 ; 46.35,89 46.35,89.05 ; 51.25,83.17 51.75,83.17 ; 29.75,78.69 29.75,78.75 32.25,81.25 37.55,81.25 ; 40.78,80.78 41.12,80.78 41.2,80.7 ; 40.75,81.65 40.75,84.46 ; 47.25,84.46 47.25,83.17 47.25,86.4 ; 61.97,24.47 61.97,24.56 ; 58.82,87.5 58.35,87.5 58.3,87.45 ; 61.65,83.8 61.55,83.9 61.55,84.15 61.5,84.2 61.5,84.3 60.65,85.15 ; 45.15,81.3 45.3,81.3 45.35,81.25 45.4,81.25 45.45,81.2 45.5,81.2 45.55,81.15 46.9,81.15 47.15,80.9 47.2,80.9 47.25,80.85 47.3,80.85 47.35,80.8 ; 31.1,87.5 31.1,88.9 31.15,88.95 33.7,88.95 34.95,90.2 35,90.2 35.05,90.25 51,90.25 ; 36.1,84.05 36,83.95 33.85,83.95 33.75,83.85 ; 35.8,84.4 35.85,84.45 35.9,84.45 37.45,86 37.6,86 37.65,86.05 37.7,86.05 37.8,86.15 37.8,86.2 37.85,86.25 37.85,86.45 38.2,86.8 ; 26.65,80.75 26.7,80.8 27.4,80.8 27.8,81.2 29.95,81.2 ; 40.45,77.9 39.85,77.9 39.75,77.8 39.7,77.8 39.65,77.75 38.2,77.75 37.8,77.35 37.75,77.35 37.7,77.3 37.65,77.3 37.6,77.25 37.4,77.25 37.35,77.2 34.55,77.2 34.5,77.25 34.3,77.25 34.25,77.3 34.2,77.3 34.15,77.35 34.1,77.35 33.95,77.5 33.95,77.55 33.9,77.6 33.9,77.65 33.85,77.7 33.85,77.75 33.8,77.8 33.8,78.05 ; 49,86.45 48.6,86.85 48.55,86.85 48.5,86.9 48.45,86.9 48.4,86.95 48.05,86.95 47.75,87.25 47.7,87.25 47.65,87.3 47.6,87.3 47.55,87.35 41.2,87.35 40.9,87.65 40.85,87.65 40.8,87.7 40.75,87.7 40.7,87.75 ; 44.3,81.3 44.15,81.15 44.15,79.95 44.1,79.9 44.1,79.85 43.65,79.4 43.65,75.9 ; 39.9,76.4 40.5,77 40.5,77.05 41,77.55 41,77.8 41.4,78.2 ; 48.75,84.46 48.75,81.65 ; 59.45,85.7 51.75,85.7 50.6,86.85 50.55,86.85 50.5,86.9 50.45,86.9 50.4,86.95 49.05,86.95 48.75,87.25 48.7,87.25 48.65,87.3 48.6,87.3 48.55,87.35 48.2,87.35 47.9,87.65 47.85,87.65 47.8,87.7 47.75,87.7 47.7,87.75 44.45,87.75 44.3,87.9 ; 24.95,79.95 25.35,80.35 25.35,80.4 25.4,80.45 25.4,80.5 25.7,80.8 25.7,81 25.75,81.05 25.75,81.15 26.1,81.5 26.2,81.5 26.25,81.55 26.55,81.55 29.3,84.3 29.5,84.3 29.55,84.35 35.75,84.35 ; 8.39,13.98 8.39,14.29 8.4,14.3 ; 63.3,87.85 62.9,88.25 62.9,88.3 62.85,88.35 62.85,88.4 62.8,88.4 62.75,88.45 62.7,88.45 62.65,88.5 59.85,88.5 59.2,89.15 59.15,89.15 59.05,89.25 56.6,89.25 56.55,89.3 56.5,89.3 56.45,89.35 56.4,89.35 56.35,89.4 56,89.4 55.95,89.35 55.9,89.35 55.85,89.3 55.8,89.3 55.6,89.1 53.25,89.1 52.6,88.45 44.1,88.45 44.05,88.4 44,88.4 43.95,88.35 43.9,88.35 43.55,88 ; 41.25,83.4 41.55,83.4 42.1,82.85 ; 46.75,81.65 46.75,84.46 ; 46.8,82.85 46.85,82.85 ; 41,86.45 40.6,86.85 40.55,86.85 40.5,86.9 40.45,86.9 40.4,86.95 40,86.95 39.9,86.85 38.25,86.85 ; 32.55,82.25 30.65,82.25 ; 61.3,85.2 61.3,85.05 61.85,84.5 61.85,84.4 62.1,84.15 62.1,84.1 62.15,84.05 62.15,77.05 57.6,72.5 57.6,72.45 57.45,72.3 57.45,72.25 57.4,72.2 57.4,72.05 57.35,72 57.35,71.85 57.3,71.8 57.3,71.3 51.5,65.5 ; 33.7,87.5 34.85,88.65 34.9,88.65 35.35,89.1 37.7,89.1 38.85,87.95 39.85,87.95 39.9,87.9 39.95,87.9 40.05,87.8 40.6,87.8 ; 57.15,79.5 57.15,79.45 57.3,79.3 57.72,79.72 57.72,79.88 ; 34.25,86.35 34.25,87.4 ; 46.45,81.1 46.45,79.9 46.6,79.75 46.65,79.75 46.7,79.7 46.75,79.7 46.8,79.65 47.65,79.65 49.3,81.3 ; 8.4,20.15 8.4,19.88 8.39,19.87 ; 50.25,84.46 50.25,83.17 50.25,86.4 ; 59.45,83.5 59.25,83.3 54.7,83.3 54.65,83.25 54.6,83.25 53.5,82.15 53.05,82.15 52.55,81.65 52.45,81.65 52.2,81.4 52,81.4 51.9,81.3 49.95,81.3 49.8,81.15 ; 7.77,16.93 7.77,16.97 8,17.2 ; 40.25,86.4 40.25,83.17 40.25,84.46 ; 45.5,59.09 45.45,59.14 45.45,59.25 48.45,62.25 ; 42.75,81.65 42.75,84.46 ; 45.75,81.65 45.75,84.46 ; 45.25,84.46 45.25,83.17 45.25,86.4 ; 33.65,87.45 32.85,86.65 32.8,86.65 32.75,86.6 32.7,86.6 32.65,86.55 31.25,86.55 30.35,85.65 30.2,85.65 30.15,85.6 24.7,85.6 20.17,81.08 19.47,81.08 ; 49.85,80.8 49.6,80.8 49.4,81 49.4,81.15 ; 46.95,81.65 47.35,81.25 47.4,81.25 47.45,81.2 47.5,81.2 47.55,81.15 ; 43.65,80.15 43.65,81.5 ; 77.57,66.34 77.21,66.34 76.75,66.8 ; 28.82,87.5 28.82,88.9 ; 33.1,75.4 33.65,75.4 34.25,76 34.3,76 34.5,76.2 34.6,76.2 34.7,76.3 34.75,76.3 34.8,76.35 34.95,76.35 35,76.4 35.05,76.4 35.15,76.5 35.35,76.5 35.4,76.55 35.65,76.55 35.7,76.6 39.35,76.6 40.1,77.35 ; 41.45,78.25 41.45,78.65 ; 45.35,77.8 45.1,78.05 44.15,78.05 ; 35.7,84.9 35.55,84.9 ; 39.7,85.4 39.7,85.1 ; 35.85,83.4 34.4,83.4 34.35,83.35 34.3,83.35 34.2,83.25 28.9,83.25 ; 43.25,84.46 43.25,83.17 43.25,86.4 ; 42.25,85.1 42.25,86.2 ; 42.55,72.8 42.55,71.1 42.45,71
  Bottom Layer w0.188: 33.44,11.84 36.14,14.55 38.11,14.55 ; 33.26,61.93 34.94,61.93 36.34,63.33 ; 71.59,42.88 72.66,42.88 73.36,43.59 ; 3.5,60.08 12.5,60.08 ; 86.39,29.68 86.6,29.9 87.5,29.9 ; 80.82,30.4 86.08,30.4 86.6,30.92 87.5,30.92 ; 88.62,59.55 88.4,59.78 88.4,59.9 87.5,59.9 ; 2.37,31.45 2.6,31.22 2.6,31.1 3.5,31.1 ; 33.28,79.88 32.18,79.88 32.18,79.3 32.12,79.24 ; 3.5,30.08 4.4,30.08 4.62,30.3 4.62,30.58 ; 55.52,13.15 57.71,15.34 57.71,15.8 ; 12.7,60.6 12.5,60.6 ; 76.45,15.57 76.45,15.03 74.57,13.16
  Bottom Layer w0.2: 26.45,34.75 24.9,33.2 24.9,31.8 24.85,31.75 24.85,31.7 24.8,31.65 24.8,31.6 24.5,31.3 24.5,31.25 24.45,31.2 24.45,31.15 24.4,31.1 24.4,31.05 12.25,18.9 12.25,18.85 12.2,18.8 12.2,18.3 8.4,14.5 8.4,14.3 ; 8,17.2 8,17.4 8.15,17.55 8.15,17.7 8.3,17.85 8.35,17.85 8.45,17.95 8.65,17.95 8.9,18.2 8.95,18.2 9,18.25 9.1,18.25 21.8,30.95 23.6,30.95 23.65,31 23.7,31 23.75,31.05 23.8,31.05 24.05,31.3 24.05,31.35 24.1,31.4 24.1,31.5 24.45,31.85 24.45,31.9 24.5,31.95 24.5,33.65 27.1,36.25 27.1,68.15 ; 25.95,80.1 25.35,79.5 25.35,61.7 25.3,61.65 25.3,61.3 25.25,61.25 25.25,61.15 25.2,61.1 25.2,61.05 24.45,60.3 24.45,57.2 24.15,56.9 24.15,36.6 24.1,36.55 24.1,32.1 23.7,31.7 23.7,31.55 23.55,31.4 23.5,31.4 23.45,31.35 19.45,31.35 8.4,20.3 8.4,20.15 ; 26.45,38.6 26.45,79.75 26.5,79.8 26.5,79.85 26.55,79.9 26.55,80.7
  Bottom Layer w0.25: 42.73,70.38 41.22,70.38 37.45,66.6 37.45,64.1 ; 41.04,73.95 41.22,73.78 41.97,73.78 ; 42.73,51.33 42.73,67.49 42.71,67.51 ; 42.73,51.33 41.97,51.33 42.73,51.33 ; 42.73,51.33 42.73,32.28 ; 33.28,22.73 32.15,22.73 31.94,22.94 31.56,22.94 ; 32.18,3.5 32.18,2.57 32.67,2.57 32.84,2.41 ; 14.22,40.33 13.1,40.33 13.1,39.22 ; 71.59,80.87 78.59,80.87 ; 61.03,32.28 61.78,32.28 ; 41.97,16.62 39.86,16.62 38.11,14.87 38.11,14.55 ; 76.45,15.57 76.45,15.64 86.39,25.58 86.39,29.68 ; 19.62,41.78 20.75,41.78 20.75,42.56 ; 52.32,41.78 51.2,41.78 51.2,43.55 ; 23.68,51.33 22.92,51.33 23.68,51.33 ; 23.68,51.33 23.68,32.28 22.92,32.28 ; 23.68,51.33 23.68,58.49 ; 76.78,60.83 76.78,63.22 ; 87.5,32.17 87.5,32.9 88.62,34.03 88.62,59.55 ; 51.2,38.46 51.2,40.33 52.32,40.33 ; 31.56,22.94 30.93,22.31 30.93,3.5 ; 31.56,22.94 31.56,41.19 32.15,41.78 ; 38.9,84.45 39.05,84.45 ; 36.34,63.33 36.58,63.09 37.82,63.09 37.87,63.14 40.25,63.14 40.78,62.61 40.78,61.72 ; 51.2,20.51 51.2,21.28 52.32,21.28 ; 60.09,35.86 60.27,35.67 61.03,35.67 ; 73.36,43.59 78.64,43.59 78.88,43.35 78.88,42.67 ; 79.14,53.82 79.32,54 79.32,54.72 80.07,54.72 ; 71.59,42.88 71.38,42.66 71.38,41.78 70.25,41.78 ; 32.7,61.93 33.26,61.93 ; 32.7,61.93 31.56,63.07 31.56,78.67 32.12,79.24 ; 32.7,61.93 32.15,61.38 32.15,60.83 ; 13.1,60.83 12.93,60.83 12.7,60.6 ; 13.1,60.83 14.22,60.83 ; 13.1,60.83 13.1,61.61 ; 52.01,76.45 52.01,78.12 52.32,78.43 ; 80.07,13.22 80.07,15.57 ; 86.39,60.74 86.57,60.92 87.5,60.92 ; 52.32,59.38 51.2,59.38 51.2,58.81 51.1,58.71 ; 45.5,59.09 54.78,49.81 54.78,49.55 ; 33.28,78.43 32.15,78.43 32.15,76.89 ; 70.04,58.17 70.04,59.17 70.25,59.38 71.38,59.38 ; 57.1,81.75 56.1,82.75 54.95,82.75 ; 42.73,32.28 41.97,32.28 42.73,32.28 ; 42.73,32.28 42.73,13.22 41.97,13.22 ; 9.21,14.27 9.46,13.57 9.44,13.54 9.44,13.46 ; 61.97,24.47 61.78,24.29 61.78,13.22 61.03,13.22 ; 14.22,41.78 13.1,41.78 12.5,42.38 12.5,60.6 9.98,63.12 9.98,86.15 ; 57.71,19.93 58.8,19.93 60.55,21.68 60.55,22.74 60.34,22.95 59.82,22.95 59.82,23.62 ; 57.71,19.93 50.96,19.93 50.61,20.28 50.61,22.14 51.01,22.54 51.2,22.73 52.32,22.73 ; 57.71,19.93 57.71,15.8 ; 60.93,3.5 60.93,7.75 55.52,13.15 ; 20.75,61.6 20.75,60.83 19.62,60.83 ; 33.44,49.94 34.65,49.94 37.47,52.77 ; 61.1,86.38 61.1,87.5 ; 79.29,17.6 79.38,17.5 80.07,17.5 80.07,16.62 ; 66.95,71.95 67.1,71.8 67.1,69.85 67.15,69.8 67.15,69.65 67.2,69.6 67.2,69.55 67.25,69.5 67.25,69.45 67.3,69.4 67.3,69.35 67.35,69.3 67.35,69.2 67.5,69.05 67.5,69 67.55,69 67.7,68.85 67.75,68.85 67.9,68.7 67.95,68.7 68.05,68.6 68.25,68.6 68.3,68.55 68.5,68.55 68.55,68.5 70.4,68.5 70.45,68.45 75.1,68.45 76.75,66.8 ; 78.73,62.59 78.73,62.55 78.88,62.4 78.88,61.72 ; 3.5,58.83 3.5,58.1 2.38,56.97 2.38,31.45 ; 60.09,73.95 60.27,73.78 61.03,73.78 ; 59.82,43.55 59.82,42.67 ; 22.92,54.72 22.17,54.72 22.12,54.78 22,54.78 ; 9.46,20.39 9.46,20.28 9.21,19.58 ; 70.06,40.14 70.25,40.33 71.38,40.33 ; 29.83,51.62 29.83,78.61 29.75,78.69 ; 60.07,87.5 60.07,82.44 59.82,82.19 ; 61.03,50.22 61.78,49.47 61.78,24.75 61.97,24.56 ; 79.71,24.45 79.71,23.21 79.43,22.93 78.1,22.93 77.9,22.73 76.78,22.73 ; 50.75,83.17 52.25,83.17 ; 30.86,74.92 30.86,79.15 32.51,80.81 34.04,80.81 ; 21.99,35.86 22.17,35.67 22.92,35.67 ; 23.44,26.04 28.37,30.98 ; 13.1,57.91 13.1,59.38 14.22,59.38 ; 87.5,63.1 87.5,62.17 ; 9.31,17.63 9.15,17.47 8.63,17.47 8.63,16.93 ; 52.32,60.83 51.2,60.83 51.2,61.63 50.97,61.86 50.97,79.65 51.2,79.88 ; 50.75,84.46 52.25,84.46 ; 60.09,16.62 61.03,16.62 ; 40.78,43.53 40.78,42.67 ; 33.28,41.78 32.15,41.78 ; 32.15,41.78 31.95,41.97 31.95,43.53 31.35,44.14 31.35,60.03 32.15,60.83 ; 61.03,51.33 61.03,50.23 ; 62.18,3.5 65.28,3.5 74.57,12.79 74.57,13.16 ; 51.2,79.88 52.32,79.88 ; 51.2,79.88 51.2,80.69 ; 38.68,60.83 38.68,62.56 ; 38.68,79.88 38.68,80.75 ; 59.82,62.6 59.82,61.72 ; 20.73,52.48 20.73,57.22 24.86,61.34 24.86,79.86 ; 41.97,35.67 41.22,35.67 41.04,35.86 ; 58.82,87.5 58.82,88.63 ; 57.72,41.78 57.72,42.89 ; 80.82,30.4 78.88,28.45 78.88,23.85 ; 70.25,41.78 69.45,40.98 69.45,23.53 70.25,22.73 71.38,22.73 71.38,22.83 72.4,23.85 78.88,23.85 ; 70.25,41.78 70.25,43.55 69.45,44.35 69.45,60.03 70.25,60.83 ; 78.88,23.85 78.88,23.62 ; 57.72,22.73 57.72,23.58 ; 61.03,70.38 60.27,70.38 60.09,70.19 ; 3.5,27.9 3.5,28.83 ; 59.9,2.37 59.9,3.5 ; 40.78,24.5 40.78,23.62 ; 80.07,51.33 80.07,50.25 80.83,49.5 80.83,32.28 79.32,32.28 79.32,29.88 79.14,29.69 ; 57.72,60.83 57.72,61.93 ; 39.8,23.53 39.8,22.73 38.68,22.73 ; 41.97,54.72 41.22,54.72 41.22,54.14 41.04,53.96 ; 29.9,3.5 29.9,6.25 ; 33.28,59.38 32.15,59.38 31.94,59.17 31.94,57.98 ; 57.72,79.88 57.72,81.05 ; 59.82,82.19 59.25,82.19 ; 59.82,82.19 59.82,80.78 ; 30.23,74.51 30.42,74.32 30.42,30.09 22.38,22.05 ; 70.25,60.83 71.38,60.83 ; 70.25,60.83 70.25,61.93 ; 32.15,60.83 33.28,60.83 ; 32.15,19.91 32.15,21.28 33.28,21.28 ; 39.78,71.53 39.78,76.36 ; 32.15,39.2 32.15,40.33 33.28,40.33 ; 79.15,35.67 79.15,35.67 80.07,35.67 ; 21.72,62.63 21.72,61.72 ; 76.78,41.78 76.78,42.88 ; 38.68,41.78 38.68,42.88 ; 61.03,54.72 60.27,54.72 60.06,54.51 60.06,53.65 ; 21.72,42.67 21.72,43.56 ; 60.97,80.25 60.97,83.97
  Bottom Layer w0.4: 30.07,87.5 30.07,86.2
  Bottom Layer w0.5: 51.1,81.95 51.9,81.95 ; 51.5,81.95 51.5,84.46
COL1: length 74.4
  In2.Cu w0.254: 24.04,49.94 v1(22.39,49.94) ; 24.04,49.94 30.72,56.62 30.72,62.46 30.9,62.64 35.72,62.64 41.06,67.97 v1(41.06,68.99) 42.75,70.68 v1(42.75,82.33) ; 24.04,49.94 24.8,49.18 24.8,30.76 24.62,30.58 v1(22.14,30.58)
  Bottom Layer w0.254: FPC2.10 v1(42.75,82.33) ; v1(22.39,49.94) 20.53,49.94 D3.1 ; v1(41.06,68.99) 41.01,68.94 D1.1 ; v1(22.14,30.58) 22.13,30.59 D7.1
COL2: length 122.8
  In2.Cu w0.254: v1(45.63,11.71) v1(45.63,30.64) v1(45.63,49.56) 45.63,61.75 47.41,63.53 54.14,63.53 v1(59.85,69.25) 61,70.39 61,82.33 57.16,86.16 42.99,86.16 v1(42.58,85.75)
  Bottom Layer w0.254: FPC2.11 43.25,85.13 43.02,85.37 42.97,85.37 v1(42.58,85.75) ; v1(45.63,11.71) 39.45,11.71 D11.1 ; 39.79,49.77 40,49.56 v1(45.63,49.56) ; v1(45.63,30.64) 39.62,30.64 D8.1 ; v1(59.85,69.25) 58.24,69.25 D2.1
COL3: length 104
  In2.Cu w0.254: v1(62.14,11.46) v1(62.14,30.51) v1(62.14,49.69) 62.14,82.33 57.7,86.77 v1(43.75,86.77)
  Bottom Layer w0.254: v1(62.14,49.69) 58.79,49.69 D5.1 ; v1(43.75,86.77) FPC2.12 ; v1(62.14,30.51) 58.79,30.51 D9.1 ; v1(62.14,11.46) 58.79,11.46 D12.1
COL4: length 125.6
  Top Layer w0.254: v1(79.79,30.85) 79.79,30.89
  In2.Cu w0.254: 82.59,30.76 79.92,30.76 79.79,30.89 ; 82.59,30.76 v1(82.59,49.81) 83.28,50.5 83.28,62.33 81.7,63.91 70.52,63.91 63.16,71.28 63.16,82.45 58.36,87.25 46.9,87.25 46.14,88.01 44.9,88.01 v1(44.62,88.3) ; 82.59,30.76 v1(82.59,13.49)
  Bottom Layer w0.254: FPC2.13 44.32,84.53 44.32,85.2 44.62,85.5 v1(44.62,88.3) ; v1(82.59,49.81) 77.42,49.81 D6.1 ; D13.1 80.77,11.67 v1(82.59,13.49) ; D10.1 v1(79.79,30.85)
ENC_A: length 50.9
  In2.Cu w0.254: v1(47.92,75.34) v1(47.92,82.71)
  Bottom Layer w0.254: v1(47.92,75.34) 47.92,73.55 47.59,73.22 47.59,69.93 43.98,66.32 22.9,66.32 21.12,68.1 15.91,68.1 SW1.A ; FPC2.21 48.25,83.04 v1(47.92,82.71)
ENC_B: length 46.6
  In2.Cu w0.254: v1(48.93,75.34) v1(48.93,82.71)
  Bottom Layer w0.254: v1(48.93,82.71) 48.75,82.89 FPC2.22 ; SW1.B 20.61,65.44 44.74,65.44 47.94,68.64 47.94,73.08 48.93,74.07 v1(48.93,75.34)
ENC_SW: length 73.8
  In2.Cu w0.254: v1(49.69,77.37) 49.95,77.63 v1(49.95,82.71)
  Bottom Layer w0.254: v1(49.69,77.37) 49.69,74.33 48.3,72.93 48.3,67.85 44.44,63.99 13.43,63.99 13.25,64.17 13.25,66.05 13.21,66.09 13.21,74.82 SW1.E ; FPC2.23 49.25,83.41 v1(49.95,82.71)
JOY_SW: length 59.4
  In2.Cu w0.254: v1(53.76,66.96) 52.11,66.96 47,72.07 47,82.37 v1(47.02,82.39)
  Bottom Layer w0.254: FPC2.20 47.75,83.43 47.02,82.7 v1(47.02,82.39) ; v1(53.76,66.96) 69.25,66.96 71.59,69.3 71.59,74.02 72.1,74.53 72.1,75.62 71.59,76.13 71.59,80.87 78.59,80.87
JOY_X: length 47.3
  In2.Cu w0.254: v1(51.22,64.42) 45.5,70.13 v1(45.5,81.56) ; v1(63.92,68.61) v1(63.92,64.42)
  Bottom Layer w0.254: 66.35,75.08 63.92,72.65 v1(63.92,68.61) ; FPC2.18 46.75,83.57 45.5,82.33 v1(45.5,81.56) ; v1(63.92,64.42) v1(51.22,64.42)
JOY_Y: length 45.3
  In2.Cu w0.254: v1(51.85,65.82) 46.39,71.28 v1(46.39,81.18)
  Bottom Layer w0.254: VR1.5 74.24,66.34 73.06,65.17 72.09,65.17 71.44,65.82 v1(51.85,65.82) ; FPC2.19 47.25,83.48 46.35,82.58 46.35,81.22 v1(46.39,81.18)
LED1: length 99.1
  Bottom Layer w0.254: FPC2.4 39.68,84.39 39.68,83.72 39.52,83.56 37.98,83.56 37.08,84.46 10.68,84.46 5.25,79.02 5.25,21.75 7.12,19.87 8.39,19.87
LED2: length 115.2
  In2.Cu w0.254: v1(7.02,24.92) v1(7.02,18.32) ; v1(11.47,83.22) 17.74,89.49 50.07,89.49 50.25,89.31 v1(50.25,88.17)
  Bottom Layer w0.254: v1(7.02,24.92) 6.52,25.43 6.52,78.26 v1(11.47,83.22) ; FPC2.25 v1(50.25,88.17) ; v1(7.02,18.32) 7.77,17.57 R5.1
LED3: length 105.6
  In2.Cu w0.254: v1(7.15,13.49) 6.26,14.38 v1(6.26,23.65)
  Bottom Layer w0.254: FPC2.5 40.18,84.39 40.18,83.72 40.03,83.58 40.03,83.57 39.66,83.2 37.84,83.2 36.93,84.11 10.84,84.11 5.63,78.9 5.63,24.29 v1(6.26,23.65) ; v1(7.15,13.49) 7.91,13.49 R2.1
ROW1: length 40.3
  In2.Cu w0.254: U4.1 57.55,72.82 57.55,75.12 56.07,76.6 51.1,76.6 v1(51.09,76.61) ; 39.78,71.53 39.78,80.24 v1(38.97,81.06)
  Bottom Layer w0.254: FPC2.6 40.75,83.79 39.81,82.85 39.29,82.85 38.9,82.45 38.9,81.13 v1(38.97,81.06) ; v1(51.09,76.61) 50.51,77.19 50.51,77.57 50.08,78.01 47.16,78.01 40.68,71.53 39.78,71.53
ROW2: length 104.7
  In2.Cu w0.254: U5.1 26.96,58.71 26.96,81.18 28.46,82.68 40.52,82.68 v1(40.55,82.71)
  Bottom Layer w0.254: 77.88,52.48 U14.1 U5.1 ; FPC2.7 41.25,83.41 v1(40.55,82.71)
ROW3: length 142.9
  In2.Cu w0.254: v1(41.19,81.94) 41.03,82.1 29.4,82.1 27.98,80.67 27.98,56.16 v1(23.53,51.72)
  Bottom Layer w0.254: v1(41.19,81.94) 41.75,82.51 FPC2.8 ; 77.88,33.44 U18.1 U16.1 20.6,33.3 13.25,33.3 10.33,36.22 10.33,44.86 11.34,45.88 21.12,45.88 23.53,48.29 v1(23.53,51.72)
ROW4: length 130.6
  In2.Cu w0.254: v1(29.83,57.94) 28.87,58.91 28.87,80.55 30.01,81.69 40.3,81.69 v1(41.19,80.8) ; v1(29.88,53.62) v1(29.88,28.86)
  Bottom Layer w0.254: v1(29.88,28.86) 29.88,16.54 32.04,14.38 77.88,14.38 ; v1(29.83,57.94) 29.83,53.68 v1(29.88,53.62) ; v1(41.19,80.8) 42.14,81.76 42.14,82.58 42.25,82.68 FPC2.9
SK6812_2: length 45.6
  Bottom Layer w0.254: 52.32,78.43 52.36,78.39 52.36,74.58 49.82,72.04 49.82,67.97 44.97,63.12 20.33,63.12 19.8,62.59 19.8,61 LED3.2
SK6812_3: length 89.8
  Bottom Layer w0.254: LED6.4 71.38,58.13 71.94,57.56 80.56,57.56 84.11,54 84.11,47.78 81.57,45.24 21.5,45.24 19.62,43.37 LED7.2
SK6812_4: length 70.7
  Bottom Layer w0.254: 38.68,22.73 38.77,22.83 38.77,24.54 41.44,27.21 81.44,27.21 83.1,28.86 83.1,38 82.92,38.18 78.09,38.18 77.63,38.64 71.44,38.64 71.38,38.7 LED10.4
SK6812_KEY: length 6.2
  Bottom Layer w0.254: 45.25,84.46 45.25,83.72 41.41,79.88
SK6812_Key: length 2.7
  Bottom Layer w0.254: 38.68,79.88 41.41,79.88
TOUCH: length 3.1
  Bottom Layer w0.254: 46.25,84.46 46.25,83.71 44.62,82.08
Touch: length 86.3
  In2.Cu w0.254: v1(44.62,82.08) 44.62,27.72 43.22,26.32 26.2,26.32 v1(17.06,17.18)
WS2812_2: length 45.1
  Bottom Layer w0.254: U9.1 65.82,7.14 78.27,7.14 84.98,13.85 84.98,29.01 85.87,29.9 U8.3
WS2812_KEY: length 3.5
  Bottom Layer w0.254: 45.88,87.41 46.52,86.77 46.52,85.9 45.82,85.2 45.82,84.53 45.75,84.46
WS2812_Key: length 19.2
  In2.Cu w0.254: v1(45.88,87.41) 39.15,87.41 v1(38.65,86.9)
  Bottom Layer w0.254: v1(38.65,86.9) 37.25,85.5 29.88,85.5 28.82,86.56 U2.1
$1N6: length 2.2
  Bottom Layer w0.254: 35.63,69.07 35.55,69 U1.2
$1N8: length 2.3
  Bottom Layer w0.254: D2.2 54.59,69 U4.2
$1N12: length 29.6
  Bottom Layer w0.254: LED2.2 57.88,80.03 57.88,80.93 57.37,81.44 52.8,81.44 52.58,81.66 52.07,81.66 51.85,81.44 48.81,81.44 47.66,80.29 47.66,79.28 45.56,77.18 33.53,77.18 33.28,77.43 LED1.4
$1N14: length 2.6
  Bottom Layer w0.254: D3.2 16.78,49.94 14.39,49.94
$1N16: length 3
  Bottom Layer w0.254: D4.2 36.21,49.94 33.44,49.94
$1N18: length 2.7
  Bottom Layer w0.254: D5.2 55.14,49.94 52.49,49.94
$1N25: length 2.9
  Bottom Layer w0.254: U18.2 55.01,30.89 D9.2
$1N26: length 2.6
  Bottom Layer w0.254: D10.2 74.06,30.89 U19.2
$1N28: length 2.8
  Bottom Layer w0.254: U16.2 14.69,30.59 D7.2
$1N33: length 2.4
  Bottom Layer w0.254: U22.2 73.68,11.84 D13.2
$1N35: length 2.9
  Bottom Layer w0.254: D12.2 55.01,11.84 U21.2
$1N36: length 2.6
  Bottom Layer w0.254: D11.2 35.83,11.84 U20.2
$1N54: length 2.5
  Bottom Layer w0.254: D6.2 73.81,49.94 71.53,49.94
$1N58: length 2.8
  Bottom Layer w0.254: U17.2 35.96,30.89 D8.2
$1N65: length 29.2
  Bottom Layer w0.254: LED3.4 14.22,58.38 14.48,58.13 26.13,58.13 30.77,62.77 38.26,62.77 38.68,62.36 38.68,60.83
$1N67: length 29.5
  Bottom Layer w0.254: LED4.4 33.81,58.85 arc(34.04,58.37) 34.52,58.14 34.71,57.94 44.87,57.94 50.46,63.53 56.68,63.53 57.72,62.48 LED5.2
$1N68: length 29
  Bottom Layer w0.254: 52.32,59.38 52.85,58.85 arc(53.09,58.37) 53.57,58.14 53.76,57.94 63.79,57.94 68.8,62.95 76.31,62.95 76.78,62.48 76.78,60.83
$1N77: length 28.9
  Bottom Layer w0.254: LED7.4 14.14,40.24 14.14,39.53 14.64,39.02 26.45,39.02 30.7,43.26 38.65,43.26 38.83,43.08 38.83,41.93 38.68,41.78
$1N78: length 28.8
  Bottom Layer w0.254: LED8.4 33.28,39.44 33.63,39.08 45.06,39.08 49.57,43.59 57.06,43.59 57.72,42.93 LED9.2
$1N79: length 29.4
  Bottom Layer w0.254: 76.78,41.78 76.78,43.18 76.11,43.84 67.86,43.84 63.03,39.02 52.36,39.02 52.32,39.06 52.32,40.33
$1N85: length 29.1
  Bottom Layer w0.254: LED11.4 33.28,20.28 33.53,20.03 44.55,20.03 49.06,24.54 57.44,24.54 57.62,24.36 57.62,22.83 LED12.2
$1N86: length 30.4
  Bottom Layer w0.254: 52.32,21.28 52.06,21.01 52.06,20.15 52.24,19.97 64.68,19.97 69.63,24.92 76.75,24.92 76.93,24.74 76.93,22.88 76.78,22.73
$2N311: length 31.6
  Bottom Layer w0.254: U2.3 31.1,89.18 31.86,89.95 57.82,89.95 58.84,88.93 58.84,87.51 U3.1
$2N312: length 45.6
  Bottom Layer w0.254: U3.3 61.45,87.15 61.45,86.73 61.61,86.57 62.03,86.57 66.15,82.45 81.7,82.45 87.5,76.65 U6.1
$2N313: length 30.6
  Bottom Layer w0.254: U8.1 85.13,34.55 85.13,59.14 85.89,59.9 U6.3
$2N318: length 31.7
  Bottom Layer w0.254: U9.3 59.9,5.57 58.59,6.89 35.56,6.89 U10.1
$2N319: length 49.9
  Bottom Layer w0.254: U10.3 29.88,3.52 29.88,5.11 29.25,5.75 13.12,5.75 8.8,10.06 2.83,10.06 2.65,10.24 2.65,25.76 3.47,26.57 3.47,28.79 U11.1
$2N320: length 28.8
  Bottom Layer w0.254: U11.3 3.08,31.1 2.45,31.73 2.45,32.62 3.5,33.67 U12.1
$2N387: length 1.9
  Top Layer w0.254: v1(9.06,18.7) 9.31,18.95 U13.2
  Bottom Layer w0.254: v1(9.06,18.7) 9.21,18.85 R1.2
$2N390: length 1.8
  Top Layer w0.254: v1(8.67,16.03) 8.67,16.86 U23.2
  Bottom Layer w0.254: 8.63,16.93 8.67,16.88 v1(8.67,16.03)
$2N391: length 1.9
  Top Layer w0.254: 9.31,14.31 9.56,14.05 v1(9.56,13.49)
  Bottom Layer w0.254: v1(9.56,13.49) 9.56,13.92 9.21,14.27

## Copper pours and planes (outline as drawn; the poured copper is in the pictures)
GND on Top Layer: -4.41,97.57 99.35,97.57 99.35,-4.03 -4.41,-4.03
GND on Top Layer: 37.45,23.81 37.49,23.81 37.54,23.79 37.58,23.78 37.63,23.75 37.66,23.73 37.71,23.7 37.74,23.68 37.78,23.64 37.81,23.61 37.85,23.57 37.87,23.54 37.9,23.49 37.92,23.46 37.95,23.41 37.96,23.37 37.98,23.32 37.98,23.28 37.99,20.79 37.98,20.73 37.98,20.69 37.96,20.64 37.95,20.6 37.92,20.55 37.9,20.52 37.87,20.47 37.85,20.44 37.81,20.4 37.79,20.37 37.74,20.33 37.71,20.31 37.66,20.28 37.63,20.26 37.58,20.23 37.54,20.22 37.49,20.2 37.45,20.2 37.39,20.19 34.5,20.2 34.46,20.2 34.41,20.22 34.37,20.23 34.32,20.26 34.29,20.28 34.24,20.31 34.21,20.33 34.16,20.37 34.14,20.4 34.1,20.44 34.08,20.47 34.05,20.52 34.03,20.55 34,20.6 33.99,20.64 33.97,20.69 33.97,20.73 33.97,23.28 33.97,23.32 33.99,23.37 34,23.41 34.03,23.46 34.05,23.49 34.08,23.54 34.1,23.57 34.14,23.61 34.16,23.64 34.21,23.68 34.24,23.7 34.29,23.73 34.32,23.75 34.37,23.78 34.41,23.79 34.46,23.81 34.5,23.81
GND on Bottom Layer: -12.92,98.45 106.84,98.45 106.84,-10.13 -12.92,-10.13
GND on Bottom Layer: -11.39,96.04 104.56,96.04 104.56,-8.73 -11.39,-8.73
GND on In1.Cu: -9.36,97.69 95.16,97.69 95.16,-9.88 -9.36,-9.88
GND on In2.Cu: -12.03,100.11 101.13,100.11 101.13,-10.76 -12.03,-10.76

## Text on the board
Top Silkscreen Layer: All work & no play | Vibe Coding. Make It Real. | Human after all
Ratline Layer: 91 x 91 / 19.05 pitch / MOUNT HOLES TBD
